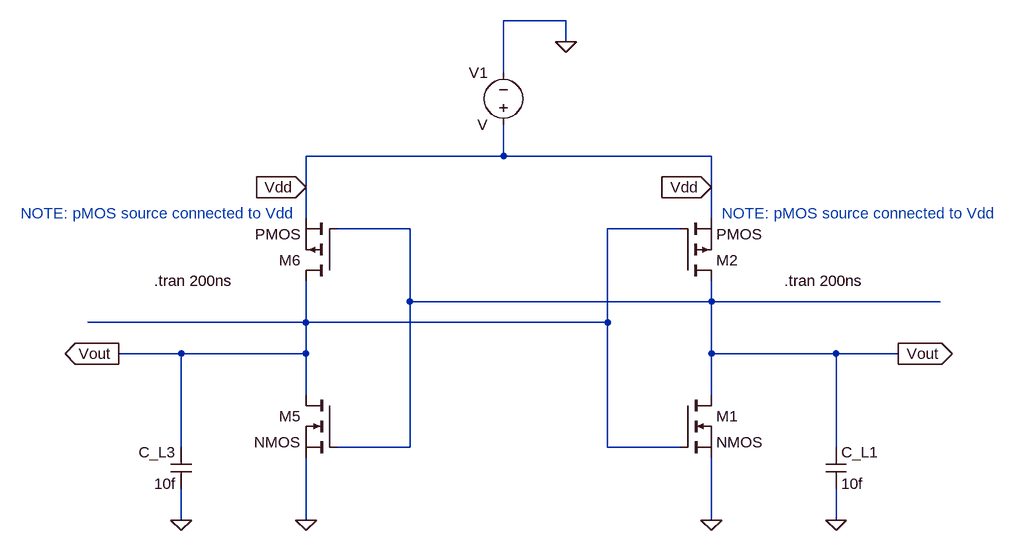
[diagram p0: schematic Draft1.asc]
Draft1.asc, the LTspice schematic file:
Version 4.1
SHEET 1 1740 680
WIRE 416 -432 320 -432
WIRE 416 -400 416 -432
WIRE 320 -352 320 -432
WIRE 320 -224 320 -272
WIRE 320 -224 16 -224
WIRE 640 -224 320 -224
WIRE 16 -176 16 -224
WIRE 640 -176 640 -224
WIRE 16 -128 16 -176
WIRE 640 -128 640 -176
WIRE 176 -112 64 -112
WIRE 592 -112 480 -112
WIRE 176 0 176 -112
WIRE 640 0 640 -32
WIRE 640 0 176 0
WIRE 992 0 640 0
WIRE 16 32 16 -32
WIRE 16 32 -320 32
WIRE 480 32 480 -112
WIRE 480 32 16 32
WIRE -176 80 -272 80
WIRE 16 80 16 32
WIRE 16 80 -176 80
WIRE 640 80 640 0
WIRE 832 80 640 80
WIRE 928 80 832 80
WIRE 16 144 16 80
WIRE 640 144 640 80
WIRE -176 224 -176 80
WIRE 176 224 176 0
WIRE 176 224 64 224
WIRE 480 224 480 32
WIRE 592 224 480 224
WIRE 832 224 832 80
WIRE -176 336 -176 288
WIRE 16 336 16 240
WIRE 640 336 640 240
WIRE 832 336 832 288
FLAG 928 80 Vout
IOPIN 928 80 Out
FLAG 640 336 0
FLAG 832 336 0
FLAG 640 -176 Vdd
IOPIN 640 -176 In
FLAG -272 80 Vout
IOPIN -272 80 Out
FLAG 16 336 0
FLAG -176 336 0
FLAG 16 -176 Vdd
IOPIN 16 -176 In
FLAG 416 -400 0
SYMBOL cap 816 224 R0
SYMATTR InstName C_L1
SYMATTR Value 10f
SYMBOL nmos 592 144 R0
SYMATTR InstName M1
SYMBOL pmos 592 -32 M180
SYMATTR InstName M2
SYMBOL cap -160 224 M0
SYMATTR InstName C_L3
SYMATTR Value 10f
SYMBOL nmos 64 144 M0
SYMATTR InstName M5
SYMBOL pmos 64 -32 R180
SYMATTR InstName M6
SYMBOL voltage 320 -256 R180
WINDOW 0 24 96 Left 2
WINDOW 3 24 16 Left 2
SYMATTR InstName V1
TEXT 656 -136 Left 2 ;NOTE: pMOS source connected to Vdd
TEXT 752 -32 Left 2 !.tran 200ns
TEXT 0 -136 Right 2 ;NOTE: pMOS source connected to Vdd
TEXT -96 -32 Right 2 !.tran 200ns

The netlist it stands for:
* Draft1.asc
C_L1 Vout 0 10f
M1 Vout Vout 0 0 NMOS
M2 Vout Vout Vdd Vdd PMOS
C_L3 Vout 0 10f
M5 Vout Vout 0 0 NMOS
M6 Vout Vout Vdd Vdd PMOS
V1 Vdd 0 V
.model NMOS NMOS
.model PMOS PMOS
.lib standard.mos
* NOTE: pMOS source connected to Vdd
.tran 200ns
* NOTE: pMOS source connected to Vdd
.tran 200ns
.backanno
.end